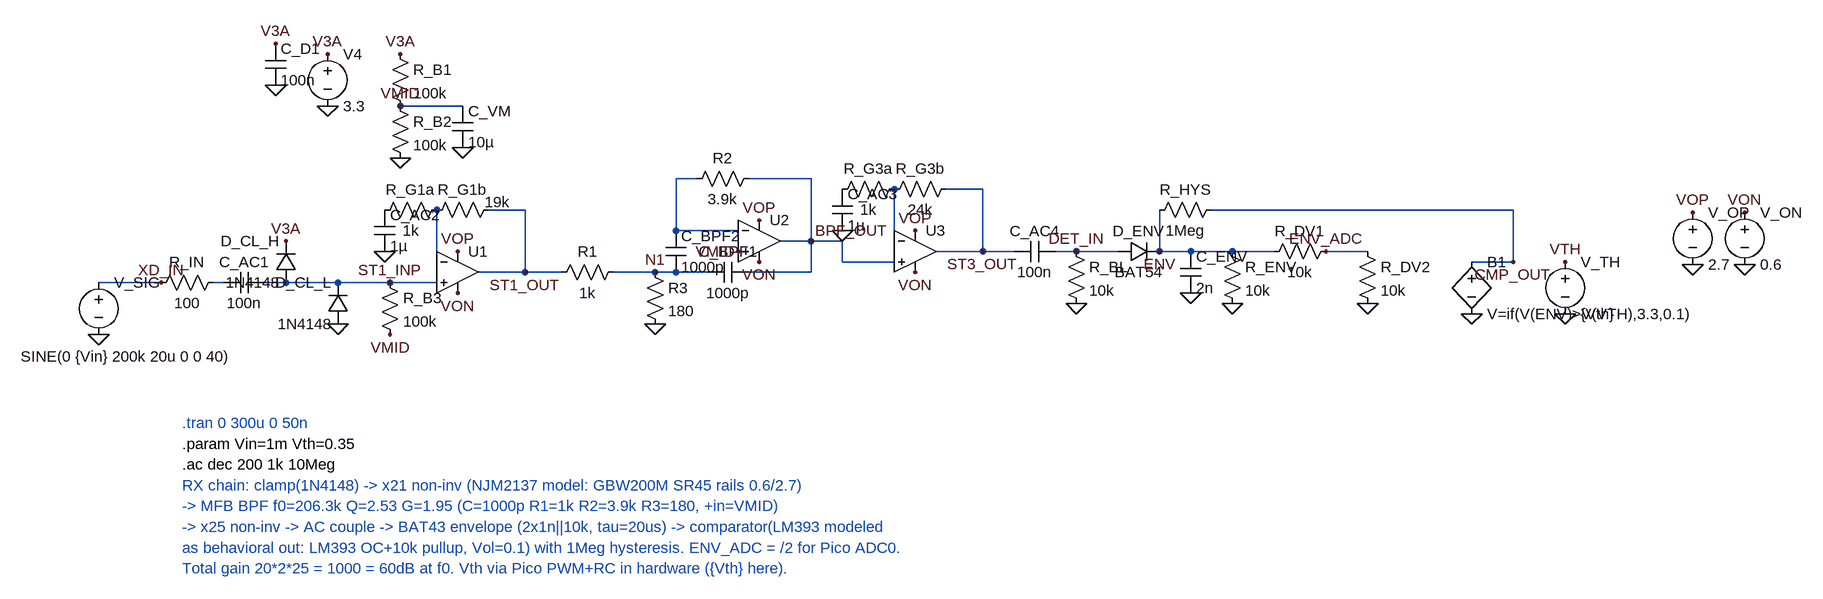
[diagram p0: schematic RX_improved.asc]
RX_improved.asc, the LTspice schematic file:
Version 4.1
SHEET 1 2000 900
WIRE -992 -64 -1088 -64
WIRE -632 48 -664 48
WIRE -456 48 -552 48
WIRE -192 64 -248 64
WIRE -896 96 -952 96
WIRE 624 96 160 96
WIRE -664 128 -664 48
WIRE -568 128 -664 128
WIRE -456 144 -456 48
WIRE -456 144 -504 144
WIRE -408 144 -456 144
WIRE -328 144 -328 64
WIRE -192 160 -192 64
WIRE -192 160 -264 160
WIRE -144 160 -192 160
WIRE -48 160 -80 160
WIRE 16 160 -48 160
WIRE 80 160 80 96
WIRE 128 160 80 160
WIRE 192 160 128 160
WIRE 256 160 192 160
WIRE 400 160 336 160
WIRE -1032 176 -1032 96
WIRE -408 176 -408 144
WIRE -328 176 -408 176
WIRE 624 176 624 96
WIRE 624 176 560 176
WIRE -896 192 -896 96
WIRE -896 192 -968 192
WIRE -840 192 -896 192
WIRE -696 192 -760 192
WIRE -664 192 -696 192
WIRE -616 192 -664 192
WIRE -456 192 -456 144
WIRE -456 192 -552 192
WIRE -1456 208 -1552 208
WIRE -1360 208 -1376 208
WIRE -1264 208 -1296 208
WIRE -1184 208 -1264 208
WIRE -1104 208 -1184 208
WIRE -1032 208 -1104 208
FLAG -1552 288 0
FLAG -1200 -64 0
FLAG -1088 16 0
FLAG -992 0 0
FLAG -1280 -96 0
FLAG -1264 144 V3A
FLAG -1184 272 0
FLAG -1104 288 VMID
FLAG -1112 160 0
FLAG -1000 160 VOP
FLAG -1000 224 VON
FLAG -696 272 0
FLAG -568 160 VMID
FLAG -536 112 VOP
FLAG -536 176 VON
FLAG -408 128 0
FLAG -296 128 VOP
FLAG -296 192 VON
FLAG -48 240 0
FLAG 128 224 0
FLAG 192 240 0
FLAG 400 240 0
FLAG 560 256 0
FLAG 704 256 0
FLAG -1200 -144 V3A
FLAG -1280 -160 V3A
FLAG -1088 -64 VMID
FLAG -1088 -144 V3A
FLAG -1456 208 XD_IN
FLAG -1104 208 ST1_INP
FLAG -896 192 ST1_OUT
FLAG -696 192 N1
FLAG -456 144 BPF_OUT
FLAG -192 160 ST3_OUT
FLAG -48 160 DET_IN
FLAG 80 160 ENV
FLAG 336 160 ENV_ADC
FLAG 624 176 CMP_OUT
FLAG 704 176 VTH
FLAG 900 100 VOP
FLAG 900 180 0
FLAG 980 100 VON
FLAG 980 180 0
SYMBOL voltage -1552 192 R0
WINDOW 3 -120 130 Left 2
SYMATTR Value SINE(0 {Vin} 200k 20u 0 0 40)
SYMATTR InstName V_SIG
SYMATTR Value2 AC 1
SYMBOL res -1360 192 R90
WINDOW 0 0 56 VBottom 2
WINDOW 3 32 56 VTop 2
SYMATTR InstName R_IN
SYMATTR Value 100
SYMBOL voltage -1200 -160 R0
SYMATTR InstName V4
SYMATTR Value 3.3
SYMBOL cap -1296 -160 R0
SYMATTR InstName C_D1
SYMATTR Value 100n
SYMBOL res -1104 -160 R0
SYMATTR InstName R_B1
SYMATTR Value 100k
SYMBOL res -1104 -80 R0
SYMATTR InstName R_B2
SYMATTR Value 100k
SYMBOL cap -1008 -64 R0
SYMATTR InstName C_VM
SYMATTR Value 10µ
SYMBOL cap -1296 192 R90
WINDOW 0 0 32 VBottom 2
WINDOW 3 32 32 VTop 2
SYMATTR InstName C_AC1
SYMATTR Value 100n
SYMBOL diode -1248 208 R180
WINDOW 0 24 64 Left 2
WINDOW 3 24 0 Left 2
SYMATTR InstName D_CL_H
SYMATTR Value 1N4148
SYMBOL diode -1168 272 R180
WINDOW 0 24 64 Left 2
WINDOW 3 24 0 Left 2
SYMATTR InstName D_CL_L
SYMATTR Value 1N4148
SYMBOL res -1120 192 R0
SYMATTR InstName R_B3
SYMATTR Value 100k
SYMBOL OpAmps\\UniversalOpAmp2 -1000 192 R0
SYMATTR InstName U1
SYMATTR Value2 Avol=1Meg GBW=200Meg Slew=45Meg
SYMBOL res -1016 80 R90
WINDOW 0 0 56 VBottom 2
WINDOW 3 32 56 VTop 2
SYMATTR InstName R_G1a
SYMATTR Value 1k
SYMBOL cap -1128 96 R0
SYMATTR InstName C_AC2
SYMATTR Value 1µ
SYMBOL res -936 80 R90
WINDOW 0 0 56 VBottom 2
WINDOW 3 -12 3 VTop 2
SYMATTR InstName R_G1b
SYMATTR Value 19k
SYMBOL res -744 176 R90
WINDOW 0 0 56 VBottom 2
WINDOW 3 32 56 VTop 2
SYMATTR InstName R1
SYMATTR Value 1k
SYMBOL res -712 176 R0
SYMATTR InstName R3
SYMATTR Value 180
SYMBOL cap -680 128 R0
SYMATTR InstName C_BPF2
SYMATTR Value 1000p
SYMBOL cap -552 176 R90
WINDOW 0 0 32 VBottom 2
WINDOW 3 32 32 VTop 2
SYMATTR InstName C_BPF1
SYMATTR Value 1000p
SYMBOL res -536 32 R90
WINDOW 0 0 56 VBottom 2
WINDOW 3 32 56 VTop 2
SYMATTR InstName R2
SYMATTR Value 3.9k
SYMBOL OpAmps\\UniversalOpAmp2 -536 144 R0
SYMATTR InstName U2
SYMATTR Value2 Avol=1Meg GBW=200Meg Slew=45Meg
SYMBOL OpAmps\\UniversalOpAmp2 -296 160 R0
SYMATTR InstName U3
SYMATTR Value2 Avol=1Meg GBW=200Meg Slew=45Meg
SYMBOL res -312 48 R90
WINDOW 0 0 56 VBottom 2
WINDOW 3 32 56 VTop 2
SYMATTR InstName R_G3a
SYMATTR Value 1k
SYMBOL cap -424 64 R0
SYMATTR InstName C_AC3
SYMATTR Value 1µ
SYMBOL res -232 48 R90
WINDOW 0 0 56 VBottom 2
WINDOW 3 32 56 VTop 2
SYMATTR InstName R_G3b
SYMATTR Value 24k
SYMBOL cap -80 144 R90
WINDOW 0 0 32 VBottom 2
WINDOW 3 32 32 VTop 2
SYMATTR InstName C_AC4
SYMATTR Value 100n
SYMBOL res -64 144 R0
SYMATTR InstName R_BL
SYMATTR Value 10k
SYMBOL diode 16 176 R270
WINDOW 0 32 32 VTop 2
WINDOW 3 0 32 VBottom 2
SYMATTR InstName D_ENV
SYMATTR Value BAT54
SYMBOL cap 112 160 R0
SYMATTR InstName C_ENV
SYMATTR Value 2n
SYMBOL res 176 144 R0
SYMATTR InstName R_ENV
SYMATTR Value 10k
SYMBOL res 352 144 R90
WINDOW 0 0 56 VBottom 2
WINDOW 3 32 56 VTop 2
SYMATTR InstName R_DV1
SYMATTR Value 10k
SYMBOL res 384 144 R0
SYMATTR InstName R_DV2
SYMATTR Value 10k
SYMBOL res 176 80 R90
WINDOW 0 0 56 VBottom 2
WINDOW 3 32 56 VTop 2
SYMATTR InstName R_HYS
SYMATTR Value 1Meg
SYMBOL bv 560 160 R0
SYMATTR Value V=if(V(ENV)>V(VTH),3.3,0.1)
SYMATTR InstName B1
SYMBOL voltage 704 160 R0
SYMATTR InstName V_TH
SYMATTR Value {Vth}
SYMBOL voltage 900 84 R0
SYMATTR InstName V_OP
SYMATTR Value 2.7
SYMBOL voltage 980 84 R0
SYMATTR InstName V_ON
SYMATTR Value 0.6
TEXT -1424 424 Left 2 ;.tran 0 300u 0 50n
TEXT -1424 456 Left 2 !.param Vin=1m Vth=0.35
TEXT -1424 488 Left 2 !.ac dec 200 1k 10Meg
TEXT -1424 520 Left 2 ;RX chain: clamp(1N4148) -> x21 non-inv (NJM2137 model: GBW200M SR45 rails 0.6/2.7)
TEXT -1424 552 Left 2 ;-> MFB BPF f0=206.3k Q=2.53 G=1.95 (C=1000p R1=1k R2=3.9k R3=180, +in=VMID)
TEXT -1424 584 Left 2 ;-> x25 non-inv -> AC couple -> BAT43 envelope (2x1n||10k, tau=20us) -> comparator(LM393 modeled
TEXT -1424 616 Left 2 ;as behavioral out: LM393 OC+10k pullup, Vol=0.1) with 1Meg hysteresis. ENV_ADC = /2 for Pico ADC0.
TEXT -1424 648 Left 2 ;Total gain 20*2*25 = 1000 = 60dB at f0. Vth via Pico PWM+RC in hardware ({Vth} here).

The netlist it stands for:
* RX_improved.asc
V_SIG XD_IN 0 SINE(0 {Vin} 200k 20u 0 0 40) AC 1
R_IN N004 XD_IN 100
V4 V3A 0 3.3
C_D1 V3A 0 100n
R_B1 V3A VMID 100k
R_B2 VMID 0 100k
C_VM VMID 0 10µ
C_AC1 ST1_INP N004 100n
D_CL_H ST1_INP V3A 1N4148
D_CL_L 0 ST1_INP 1N4148
R_B3 ST1_INP VMID 100k
X§U1 ST1_INP N003 VOP VON ST1_OUT level2 Avol=1Meg GBW=200Meg Slew=45Meg Ilimit=25m Rail=0 Vos=0 En=0 Enk=0 In=0 Ink=0 Rin=500Meg  ; pins In+ In- V+ V- OUT
R_G1a N003 P001 1k
C_AC2 P001 0 1µ
R_G1b ST1_OUT N003 19k
R1 N1 ST1_OUT 1k
R3 N1 0 180
C_BPF2 N001 N1 1000p
C_BPF1 BPF_OUT N1 1000p
R2 BPF_OUT N001 3.9k
X§U2 VMID N001 VOP VON BPF_OUT level2 Avol=1Meg GBW=200Meg Slew=45Meg Ilimit=25m Rail=0 Vos=0 En=0 Enk=0 In=0 Ink=0 Rin=500Meg  ; pins In+ In- V+ V- OUT
X§U3 BPF_OUT N002 VOP VON ST3_OUT level2 Avol=1Meg GBW=200Meg Slew=45Meg Ilimit=25m Rail=0 Vos=0 En=0 Enk=0 In=0 Ink=0 Rin=500Meg  ; pins In+ In- V+ V- OUT
R_G3a N002 P002 1k
C_AC3 P002 0 1µ
R_G3b ST3_OUT N002 24k
C_AC4 DET_IN ST3_OUT 100n
R_BL DET_IN 0 10k
D_ENV DET_IN ENV BAT54
C_ENV ENV 0 2n
R_ENV ENV 0 10k
R_DV1 ENV_ADC ENV 10k
R_DV2 ENV_ADC 0 10k
R_HYS CMP_OUT ENV 1Meg
B1 CMP_OUT 0 V=if(V(ENV)>V(VTH),3.3,0.1)
V_TH VTH 0 {Vth}
V_OP VOP 0 2.7
V_ON VON 0 0.6
.model D D
.lib standard.dio
* .tran 0 300u 0 50n
.param Vin=1m Vth=0.35
.ac dec 200 1k 10Meg
* RX chain: clamp(1N4148) -> x21 non-inv (NJM2137 model: GBW200M SR45 rails 0.6/2.7)
* -> MFB BPF f0=206.3k Q=2.53 G=1.95 (C=1000p R1=1k R2=3.9k R3=180, +in=VMID)
* -> x25 non-inv -> AC couple -> BAT43 envelope (2x1n||10k, tau=20us) -> comparator(LM393 modeled
* as behavioral out: LM393 OC+10k pullup, Vol=0.1) with 1Meg hysteresis. ENV_ADC = /2 for Pico ADC0.
* Total gain 20*2*25 = 1000 = 60dB at f0. Vth via Pico PWM+RC in hardware ({Vth} here).
.lib UniversalOpAmp2.lib
.backanno
.end